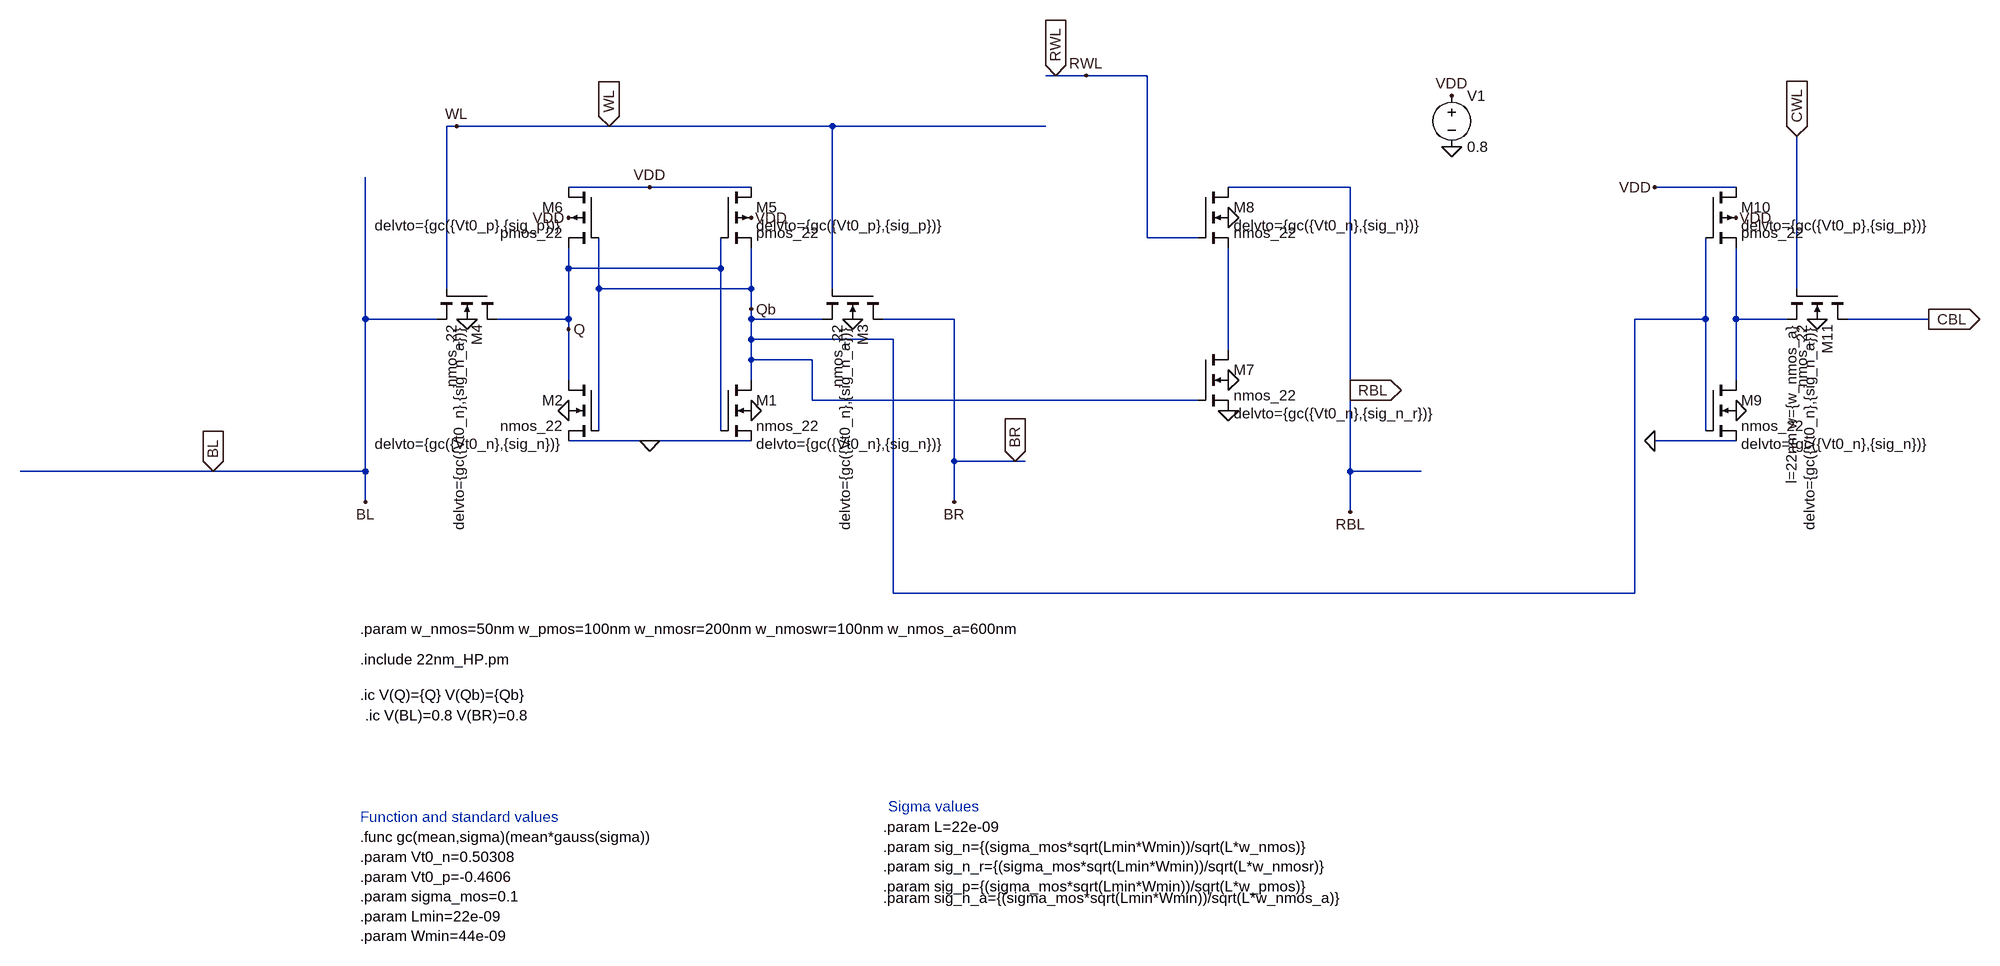
[diagram p0: schematic vt_cell.asc]
vt_cell.asc, the LTspice schematic file:
Version 4.1
SHEET 1 2080 848
WIRE 320 -528 304 -528
WIRE 368 -528 320 -528
WIRE 464 -528 368 -528
WIRE -624 -448 -640 -448
WIRE -384 -448 -624 -448
WIRE -32 -448 -384 -448
WIRE 304 -448 -32 -448
WIRE -320 -352 -448 -352
WIRE -160 -352 -320 -352
WIRE 784 -352 592 -352
WIRE 1392 -352 1264 -352
WIRE 464 -272 464 -528
WIRE 544 -272 464 -272
WIRE -448 -224 -448 -256
WIRE -208 -224 -208 -272
WIRE -208 -224 -448 -224
WIRE -640 -192 -640 -448
WIRE -400 -192 -400 -272
WIRE -160 -192 -160 -256
WIRE -160 -192 -400 -192
WIRE -32 -192 -32 -448
WIRE 1488 -192 1488 -432
WIRE -160 -160 -160 -192
WIRE -768 -144 -768 -368
WIRE -656 -144 -768 -144
WIRE -448 -144 -448 -224
WIRE -448 -144 -560 -144
WIRE -160 -144 -160 -160
WIRE -48 -144 -160 -144
WIRE 160 -144 48 -144
WIRE 1344 -144 1344 -272
WIRE 1344 -144 1232 -144
WIRE 1392 -144 1392 -256
WIRE 1472 -144 1392 -144
WIRE 1696 -144 1568 -144
WIRE -448 -128 -448 -144
WIRE -160 -112 -160 -144
WIRE 64 -112 -160 -112
WIRE 592 -96 592 -256
WIRE -160 -80 -160 -112
WIRE -64 -80 -160 -80
WIRE -448 -48 -448 -128
WIRE -160 -48 -160 -80
WIRE 1392 -48 1392 -144
WIRE 784 -32 784 -352
WIRE -64 -16 -64 -80
WIRE 544 -16 -64 -16
WIRE -400 32 -400 -192
WIRE -208 32 -208 -224
WIRE 1344 32 1344 -144
WIRE -320 48 -448 48
WIRE -160 48 -320 48
WIRE 1392 48 1264 48
WIRE 160 80 160 -144
WIRE 256 80 160 80
WIRE 272 80 256 80
WIRE -1008 96 -1312 96
WIRE -768 96 -768 -144
WIRE -768 96 -1008 96
WIRE 784 96 784 -32
WIRE 896 96 784 96
WIRE -768 144 -768 96
WIRE 160 144 160 80
WIRE 784 160 784 96
WIRE 64 288 64 -112
WIRE 1232 288 1232 -144
WIRE 1232 288 64 288
FLAG 944 -416 0
FLAG 944 -496 VDD
FLAG -320 -352 VDD
FLAG -448 -304 VDD
FLAG -160 -304 VDD
FLAG 0 -144 0
FLAG -160 0 0
FLAG -448 0 0
FLAG -608 -144 0
FLAG -768 144 BL
FLAG 160 144 BR
FLAG -624 -448 WL
FLAG 592 -48 0
FLAG 592 -304 0
FLAG 368 -528 RWL
FLAG 784 160 RBL
FLAG -160 -160 Qb
FLAG -448 -128 Q
FLAG 592 0 0
FLAG -320 48 0
FLAG -384 -448 WL
IOPIN -384 -448 In
FLAG 320 -528 RWL
IOPIN 320 -528 In
FLAG 784 -32 RBL
IOPIN 784 -32 Out
FLAG 1264 -352 VDD
FLAG 1392 -304 VDD
FLAG 1392 0 0
FLAG 1264 48 0
FLAG 1520 -144 0
FLAG 1488 -432 CWL
IOPIN 1488 -432 In
FLAG 1696 -144 CBL
IOPIN 1696 -144 Out
FLAG -1008 96 BL
IOPIN -1008 96 In
FLAG 256 80 BR
IOPIN 256 80 In
SYMBOL nmos4 -208 -48 R0
WINDOW 39 56 100 Left 2
SYMATTR SpiceLine delvto={gc({Vt0_n},{sig_n})}
SYMATTR InstName M1
SYMATTR Value nmos_22
SYMATTR Value2 l=22nm w={w_nmos}
SYMBOL nmos4 -400 -48 M0
WINDOW 39 56 100 Left 2
SYMATTR SpiceLine delvto={gc({Vt0_n},{sig_n})}
SYMATTR InstName M2
SYMATTR Value nmos_22
SYMATTR Value2 l=22nm w={w_nmos}
SYMBOL nmos4 48 -192 R90
WINDOW 39 56 60 Left 2
SYMATTR SpiceLine delvto={gc({Vt0_n},{sig_n_a})}
SYMATTR InstName M3
SYMATTR Value nmos_22
SYMATTR Value2 l=22nm w={w_nmos_a}
SYMBOL nmos4 -560 -192 R90
WINDOW 39 56 60 Left 2
SYMATTR SpiceLine delvto={gc({Vt0_n},{sig_n_a})}
SYMATTR InstName M4
SYMATTR Value nmos_22
SYMATTR Value2 l=22nm w={w_nmos_a}
SYMBOL pmos4 -208 -352 R0
WINDOW 39 56 60 Left 2
SYMATTR SpiceLine delvto={gc({Vt0_p},{sig_p})}
SYMATTR InstName M5
SYMATTR Value pmos_22
SYMATTR Value2 l=22nm w={w_pmos}
SYMBOL pmos4 -400 -352 M0
WINDOW 39 56 60 Left 2
SYMATTR SpiceLine delvto={gc({Vt0_p},{sig_p})}
SYMATTR InstName M6
SYMATTR Value pmos_22
SYMATTR Value2 l=22nm w={w_pmos}
SYMBOL voltage 944 -512 R0
WINDOW 123 0 0 Left 0
WINDOW 39 0 0 Left 0
SYMATTR InstName V1
SYMATTR Value 0.8
SYMBOL nmos4 544 -96 R0
WINDOW 39 56 100 Left 2
SYMATTR SpiceLine delvto={gc({Vt0_n},{sig_n_r})}
SYMATTR InstName M7
SYMATTR Value nmos_22
SYMATTR Value2 l=22nm w={w_nmosr}
SYMBOL nmos4 544 -352 R0
WINDOW 39 56 60 Left 2
SYMATTR SpiceLine delvto={gc({Vt0_n},{sig_n})}
SYMATTR InstName M8
SYMATTR Value nmos_22
SYMATTR Value2 l=22nm w={w_nmos}
SYMBOL nmos4 1344 -48 R0
WINDOW 39 56 100 Left 2
SYMATTR SpiceLine delvto={gc({Vt0_n},{sig_n})}
SYMATTR InstName M9
SYMATTR Value nmos_22
SYMATTR Value2 l=22nm w={w_nmos}
SYMBOL pmos4 1344 -352 R0
WINDOW 39 56 60 Left 2
SYMATTR SpiceLine delvto={gc({Vt0_p},{sig_p})}
SYMATTR InstName M10
SYMATTR Value pmos_22
SYMATTR Value2 l=22nm w={w_pmos}
SYMBOL nmos4 1568 -192 R90
WINDOW 39 56 60 Left 2
WINDOW 123 56 88 Left 2
SYMATTR SpiceLine delvto={gc({Vt0_n},{sig_n_a})}
SYMATTR Value2 l=22nm w={w_nmos_a}
SYMATTR InstName M11
SYMATTR Value nmos_22
TEXT -776 392 Left 2 !.include 22nm_HP.pm
TEXT -776 344 Left 2 !.param w_nmos=50nm w_pmos=100nm w_nmosr=200nm w_nmoswr=100nm w_nmos_a=600nm
TEXT -776 448 Left 2 !.ic V(Q)={Q} V(Qb)={Qb}
TEXT -776 672 Left 2 !.func gc(mean,sigma)(mean*gauss(sigma))\n.param Vt0_n=0.50308\n.param Vt0_p=-0.4606\n.param sigma_mos=0.1\n.param Lmin=22e-09\n.param Wmin=44e-09
TEXT 48 656 Left 2 !.param L=22e-09\n.param sig_n={(sigma_mos*sqrt(Lmin*Wmin))/sqrt(L*w_nmos)}\n.param sig_n_r={(sigma_mos*sqrt(Lmin*Wmin))/sqrt(L*w_nmosr)}\n.param sig_p={(sigma_mos*sqrt(Lmin*Wmin))/sqrt(L*w_pmos)}
TEXT -776 640 Left 2 ;Function and standard values
TEXT 56 624 Left 2 ;Sigma values
TEXT -768 480 Left 2 !.ic V(BL)=0.8 V(BR)=0.8
TEXT 48 768 Left 2 !.param sig_n_a={(sigma_mos*sqrt(Lmin*Wmin))/sqrt(L*w_nmos_a)}

The netlist it stands for:
* vt_cell.asc
M1 Qb Q 0 0 nmos_22 l=22nm w={w_nmos} delvto={gc({Vt0_n},{sig_n})}
M2 Q Qb 0 0 nmos_22 l=22nm w={w_nmos} delvto={gc({Vt0_n},{sig_n})}
M3 BR WL Qb 0 nmos_22 l=22nm w={w_nmos_a} delvto={gc({Vt0_n},{sig_n_a})}
M4 Q WL BL 0 nmos_22 l=22nm w={w_nmos_a} delvto={gc({Vt0_n},{sig_n_a})}
M5 VDD Q Qb VDD pmos_22 l=22nm w={w_pmos} delvto={gc({Vt0_p},{sig_p})}
M6 VDD Qb Q VDD pmos_22 l=22nm w={w_pmos} delvto={gc({Vt0_p},{sig_p})}
V1 VDD 0 0.8
M7 N002 Qb 0 0 nmos_22 l=22nm w={w_nmosr} delvto={gc({Vt0_n},{sig_n_r})}
M8 RBL RWL N002 0 nmos_22 l=22nm w={w_nmos} delvto={gc({Vt0_n},{sig_n})}
M9 N001 Qb 0 0 nmos_22 l=22nm w={w_nmos} delvto={gc({Vt0_n},{sig_n})}
M10 VDD Qb N001 VDD pmos_22 l=22nm w={w_pmos} delvto={gc({Vt0_p},{sig_p})}
M11 CBL CWL N001 0 nmos_22 l=22nm w={w_nmos_a} delvto={gc({Vt0_n},{sig_n_a})}
.model NMOS NMOS
.model PMOS PMOS
.lib standard.mos
.include 22nm_HP.pm
.param w_nmos=50nm w_pmos=100nm w_nmosr=200nm w_nmoswr=100nm w_nmos_a=600nm
.ic V(Q)={Q} V(Qb)={Qb}
.func gc(mean,sigma)(mean*gauss(sigma))
.param Vt0_n=0.50308
.param Vt0_p=-0.4606
.param sigma_mos=0.1
.param Lmin=22e-09
.param Wmin=44e-09
.param L=22e-09
.param sig_n={(sigma_mos*sqrt(Lmin*Wmin))/sqrt(L*w_nmos)}
.param sig_n_r={(sigma_mos*sqrt(Lmin*Wmin))/sqrt(L*w_nmosr)}
.param sig_p={(sigma_mos*sqrt(Lmin*Wmin))/sqrt(L*w_pmos)}
* Function and standard values
* Sigma values
.ic V(BL)=0.8 V(BR)=0.8
.param sig_n_a={(sigma_mos*sqrt(Lmin*Wmin))/sqrt(L*w_nmos_a)}
.backanno
.end